# Altium schematic sheet Battery_Charging_Section.SchDoc
size A4; DocumentNumber: 2; SheetNumber: 2; SheetTotal: 9
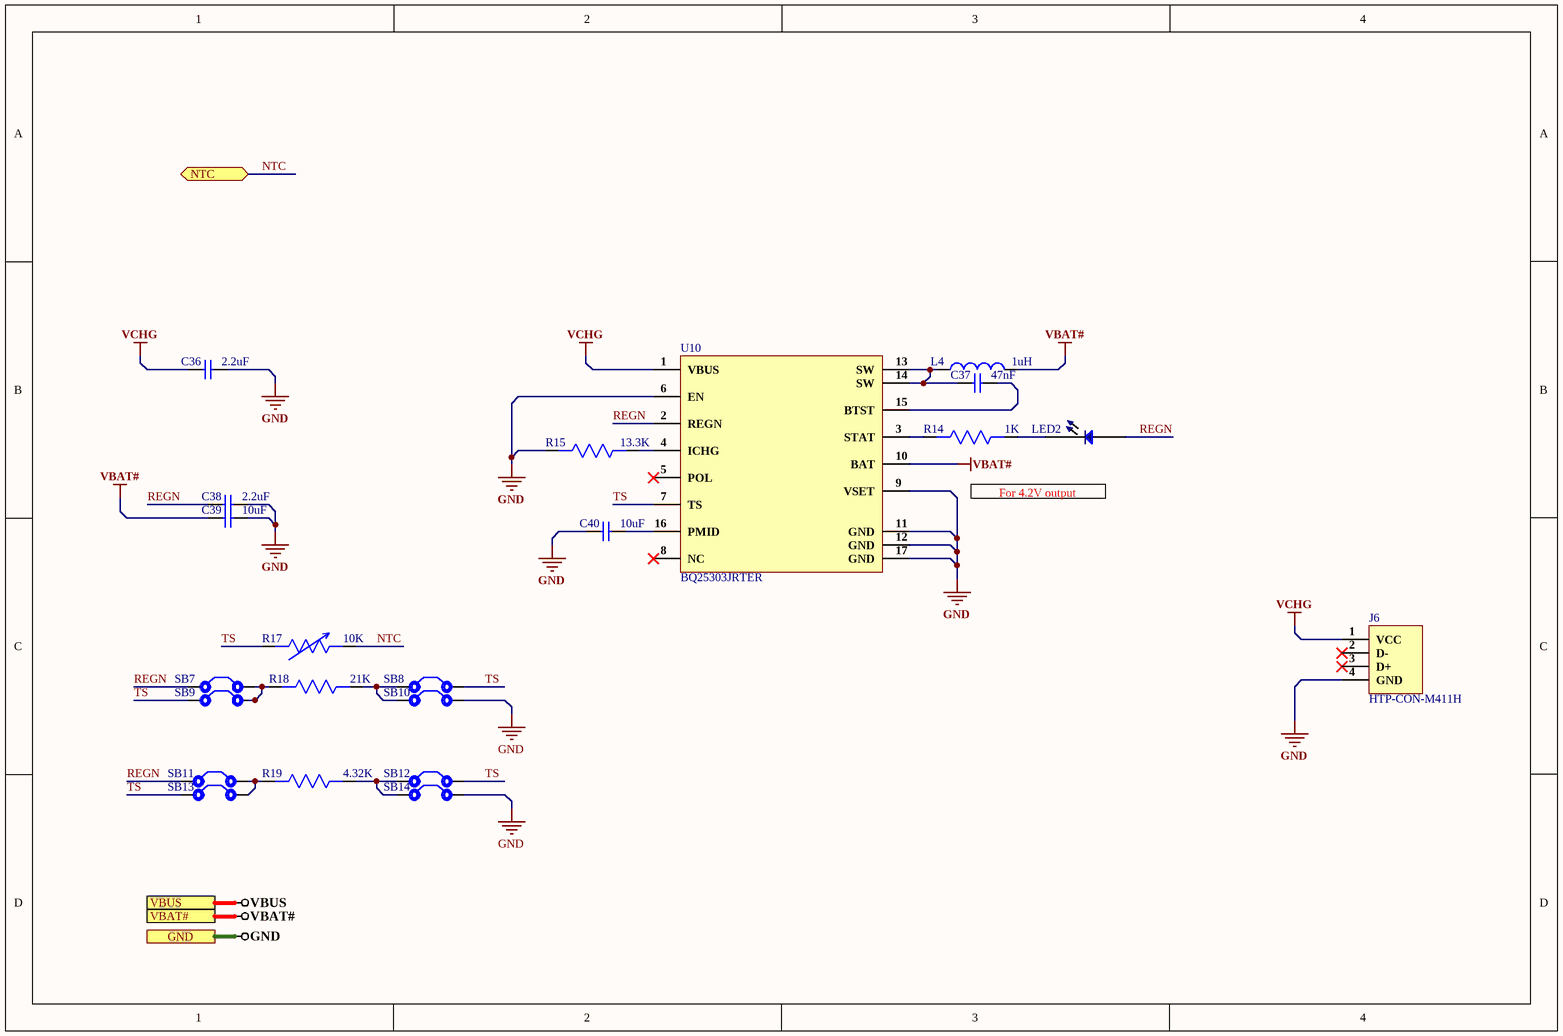
[diagram p0: Battery_Charging_Section.SchDoc]

## Parts
C36  2.2uF  [CAP 0201]
C37  47nF  [CAP 0201]
C38  2.2uF  [CAP 0201]
C39  10uF  [Cap 0402]
C40  10uF  [Cap 0402]
J6  HTP-CON-M411H  [HTP-CON-M411H]
L4  1uH  [IND  0806]
LED2  16-213/GHC-YR1S1/3T  [LED 0402]  (value not drawn)
R14  1K  [Res-0201]
R15  13.3K  [Res-0201]
R17  10K  [Res-0201]
R18  21K  [Res-0201]
R19  4.32K  [Res-0201]
SB7  Solder Bridge  [Solder Bridge]  (value not drawn)
SB8  Solder Bridge  [Solder Bridge]  (value not drawn)
SB9  Solder Bridge  [Solder Bridge]  (value not drawn)
SB10  Solder Bridge  [Solder Bridge]  (value not drawn)
SB11  Solder Bridge  [Solder Bridge]  (value not drawn)
SB12  Solder Bridge  [Solder Bridge]  (value not drawn)
SB13  Solder Bridge  [Solder Bridge]  (value not drawn)
SB14  Solder Bridge  [Solder Bridge]  (value not drawn)
U10  BQ25303JRTER  [16-WQFN (3x3)]

## Ports
GND, NTC (bidir), VBAT#, VBUS

## Nets
GND: C36.2 C38.2 C39.2 C40.1 J6.4(GND) R15.2 SB10.2 SB14.2 U10.6(EN) U10.9(VSET) U10.11(GND) U10.12(GND) U10.17(GND) ; port GND
VBAT#: C39.1 L4.2 U10.10(BAT) ; port VBAT#
VBUS: port VBUS
VCHG: C36.1 J6.1(VCC) U10.1(VBUS)
NTC: R17.1 ; port NTC
REGN: C38.1 LED2.1 SB7.1 SB11.1 U10.2(REGN)
TS: R17.2 SB8.2 SB9.1 SB12.2 SB13.1 U10.7(TS)
NetC37_1: C37.1 L4.1 U10.13(SW) U10.14(SW)
NetC37_2: C37.2 U10.15(BTST)
NetC40_2: C40.2 U10.16(PMID)
NetLED2_2: LED2.2 R14.1
NetR14_2: R14.2 U10.3(STAT)
NetR15_1: R15.1 U10.4(ICHG)
NetR18_1: R18.1 SB8.1 SB10.1
NetR18_2: R18.2 SB7.2 SB9.2
NetR19_1: R19.1 SB12.1 SB14.1
NetR19_2: R19.2 SB11.2 SB13.2

Not connected (* = marked no-connect by the designer): J6 2(D-)* 3(D+)*; U10 5(POL)* 8(NC)*

## Notes on the sheet
- For 4.2V output

## Library data of the parts
C36 C38 = GRM033R61A225ME47D: CAP CER 2.2UF 10V X5R 0201; Manufacturer: Murata; Tolerance: 20%; Supplier 1: Avnet; Manufacturer Part Number: GRM033R61A225ME47D; RoHS: Yes; Category: Ceramic Capacitors; Pricing 1: 15000=0.04772, 30000=0.04483, 60000=0.04193, 90000=0.03904, 120000=0.03615, 150000=0.03495, 1500000=0.03374 (USD); Mount: Surface Mount; Case/Package: 0201; Case Code (Metric): 0603; Case Code (Imperial): 0201; Min Operating Temperature: -55°C; Max Operating Temperature: 85°C; Packaging: Tape and Reel; Capacitance: 2.2uF; Voltage Rating: 10V; Voltage Rating (DC): 10V; Dielectric: X5R; Length: 0.024inch; Width: 0.012inch; Thickness: 0.015inch; RoHS Compliant: Yes; ComponentLink1URL: http://search.murata.co.jp/Ceramy/image/img/A01X/G101/ENG/GRM033R61A225ME47-01.pdf?src-supplier=Digi-Key; ComponentLink1Description: http://search.murata.co.jp/Ceramy/image/img/A01X/G101/ENG/GRM033R61A225ME47-01.pdf?src-supplier=Digi-Key; ComponentLink2URL: https://www.murata.com/~/media/webrenewal/support/library/catalog/products/capacitor/mlcc/c02e.ashx?la=en-us&src-supplier=Digi-Key; ComponentLink2Description: https://www.murata.com/~/media/webrenewal/support/library/catalog/products/capacitor/mlcc/c02e.ashx?la=en-us&src-supplier=Digi-Key; Supplier Part Number 1: GRM033R61A225ME47D
C37 = GRM033R61C473KE84D: CAP SMD .047uF 16V 0201; Manufacturer: Murata; Tolerance: 10%; Dielectric: X5R; Supplier 1: Digi-Key; Manufacturer Part Number: GRM033R61C473KE84D; RoHS: Yes; Category: Ceramic Capacitors; Stock 1: 292349; Pricing 1: 1=0.10000, 10=0.06800, 50=0.03720, 100=0.03040, 500=0.02174, 1000=0.01708, 2500=0.01552, 5000=0.01428 (USD); Mount: Surface Mount; Case/Package: 0201; Case Code (Metric): 0603; Case Code (Imperial): 0201; Weight: 1.2E-05oz; Min Operating Temperature: -55°C; Max Operating Temperature: 85°C; Package Quantity: 15000; Packaging: Tape and Reel; Capacitance: 47nF; Voltage Rating: 16V; Voltage Rating (DC): 16V; Termination: SMD/SMT; Length: 0.024inch; Width: 0.012inch; Height: 0.3mm; Thickness: 0.013inch; Lead Free: Lead Free; RoHS Compliant: Yes; ComponentLink1URL: https://datasheet.ciiva.com/18699/grm033r61c473ke84-01-18699268.pdf?src-supplier=Digi-Key; ComponentLink1Description: https://datasheet.ciiva.com/18699/grm033r61c473ke84-01-18699268.pdf?src-supplier=Digi-Key; ComponentLink2URL: https://datasheet.ciiva.com/18699/partnumbering-e-01-18699269.pdf?src-supplier=Digi-Key; ComponentLink2Description: https://datasheet.ciiva.com/18699/partnumbering-e-01-18699269.pdf?src-supplier=Digi-Key; ComponentLink3URL: https://datasheet.ciiva.com/24221/c02e-24221301.pdf?src-supplier=Mouser; ComponentLink3Description: https://datasheet.ciiva.com/24221/c02e-24221301.pdf?src-supplier=Mouser; ComponentLink4URL: https://datasheet.ciiva.com/18699/partnumbering-e-01-18699270.pdf?src-supplier=Digi-Key; ComponentLink4Description: https://datasheet.ciiva.com/18699/partnumbering-e-01-18699270.pdf?src-supplier=Digi-Key; Supplier Part Number 1: 490-7227-1-ND
C39 C40 = GRM155R61A106ME44D: 10uF ±20% 10V X5R 0402 Multilayer Ceramic Capacitors MLCC - SMD/SMT RoHS; Manufacturer: Murata Electronics; Package: 0402; Capacitance: 10uF; Tolerance: ±20%; Voltage - Rated: Voltage - Rated; Temperature Coefficient: X5R
J6 = HTP-CON-M411H: Straight 4 pin magnetic data connector, stably working, high quality magnetic connectors; Manufacturer: HYTEPRO; Value: Custom; Manufacturer Part No: HTP-CON-M411H; Package: Custom; ComponentLink1Description: Supplier Link; ComponentLink1URL: https://www.hyte.pro/product/m411h.html
L4 = DFE201610E-1R0M=P2: Inductor Power Shielded Wirewound 1uH 20% 1MHz Metal 2.7A 0.057Ohm DCR 0806 T/R; Manufacturer: Murata; Supplier 1: Digi-Key; Manufacturer Part Number: DFE201610E-1R0M=P2; RoHS: Yes; Category: Fixed Inductors; Stock 1: 27; Pricing 1: 1=0.37000, 10=0.32800, 25=0.28680, 50=0.24560, 100=0.22520, 250=0.20476, 500=0.19246, 1000=0.14742 (USD); RoHS Compliant: Yes; ComponentLink1URL: http://www.farnell.com/datasheets/2339713.pdf?src-supplier=Farnell; ComponentLink1Description: http://www.farnell.com/datasheets/2339713.pdf?src-supplier=Farnell; Supplier Part Number 1: 490-18106-1-ND
LED2 = 16-213/GHC-YR1S1/3T: Green 520~535nm 0402 Light Emitting Diodes (LED) RoHS; Manufacturer: Everlight Elec; Luminous Intensity (IF=20mA): 112~285mcd; Package: 0402; Illumination Color: Green; Dominant Wavelength / Coordinate rank: 520~535nm; Mounting Type: Surface Mount
R14 = RC0201FR-071KL: YAGEO - RC0201FR-071KL - RES, 1K, 1%, 0.05W, 0201, THICK FILM; Resistance: 1kR; Temperature Coefficient: 200ppm/°C; Power Rating: 50mW; Voltage Rating: 25V; Supplier 1: Digi-Key; Manufacturer: Yageo; Manufacturer Part Number: RC0201FR-071KL; RoHS: Yes; Category: Chip SMD Resistors; Stock 1: 1020398; Pricing 1: 1=0.10000, 10=0.04200, 100=0.01700, 1000=0.00765, 2500=0.00664, 5000=0.00548 (USD); Case/Package: 0201; Contact Plating: Tin,Matte; Case Code (Metric): 0603; Case Code (Imperial): 0201; Min Operating Temperature: -55°C; Max Operating Temperature: 125°C; Tolerance: 1%; Resistor Type: Thick Film; Package Quantity: 10000; Packaging: Tape and Reel; Number of Terminations: 2; Termination: SMD/SMT; Max Power Dissipation: 50mW; Working Voltage: 25V; Features: Moisture Resistant; Series: RC; Resistance Tolerance: 1%; Technology: THICK FILM; Construction: Rectangular; Length: 0.024inch; Width: 0.012inch; Height: 0.01inch; Depth: 0.3mm; Radiation Hardening: No; REACH SVHC: Unknown; Military Standard: Not; Lead Free: Lead Free; RoHS Compliant: Yes; ComponentLink1URL: https://datasheet.ciiva.com/28419/pyu-rc0201-51-rohs-l-8-28419637.pdf?src-supplier=Avnet+Europe; ComponentLink1Description: https://datasheet.ciiva.com/28419/pyu-rc0201-51-rohs-l-8-28419637.pdf?src-supplier=Avnet+Europe; ComponentLink2URL: https://datasheet.ciiva.com/16855/pyu-rc0201-51-rohs-l-8-16855830.pdf?src-supplier=Avnet+Europe; ComponentLink2Description: https://datasheet.ciiva.com/16855/pyu-rc0201-51-rohs-l-8-16855830.pdf?src-supplier=Avnet+Europe; ComponentLink3URL: https://datasheet.ciiva.com/22698/1563626-22698505.pdf?src-supplier=Element14; ComponentLink3Description: https://datasheet.ciiva.com/22698/1563626-22698505.pdf?src-supplier=Element14; ComponentLink4URL: https://datasheet.ciiva.com/29721/pyu-r-int-thick-7-29721195.pdf?src-supplier=Digi-Key; ComponentLink4Description: https://datasheet.ciiva.com/29721/pyu-r-int-thick-7-29721195.pdf?src-supplier=Digi-Key; ComponentLink5URL: https://datasheet.ciiva.com/7672/1563626-7672204.pdf?src-supplier=Element14; ComponentLink5Description: https://datasheet.ciiva.com/7672/1563626-7672204.pdf?src-supplier=Element14; ComponentLink6URL: https://datasheet.ciiva.com/29721/pyu-r-int-thick-7-29721196.pdf?src-supplier=Digi-Key; ComponentLink6Description: https://datasheet.ciiva.com/29721/pyu-r-int-thick-7-29721196.pdf?src-supplier=Digi-Key; ComponentLink7URL: https://datasheet.ciiva.com/8896/pyu-rc0201-51-rohs-l-8-8896174.pdf?src-supplier=Avnet; ComponentLink7Description: https://datasheet.ciiva.com/8896/pyu-rc0201-51-rohs-l-8-8896174.pdf?src-supplier=Avnet; Supplier Part Number 1: 311-1KMCT-ND
R15 = 0201WMF1332TEE: RES SMD 13.3K  1/20W 0201; Manufacturer: UNI-ROYAL(Uniroyal Elec); Temperature Coefficient: ±200ppm/℃; Package: 0201; Power: 1/20W
R17 = NCP03XH103F05RL: NTC Thermistors 0201; Manufacturer: Murata; Tolerance: 1%; Resistance: 10kR; Power Rating: 100mW; Supplier 1: Arrow Electronics; Manufacturer Part Number: NCP03XH103F05RL; RoHS: Yes; Category: Thermistors; Stock 1: 13718; Pricing 1: 1=0.25690, 10=0.22690, 25=0.17210, 100=0.14240, 250=0.14110, 500=0.11960, 1000=0.10070, 3000=0.09970, 6000=0.08620, 15000=0.18060, 150000=0.17050, 1500000=0.11080, 7500000=0.07850 (USD); Mount: Surface Mount; Case/Package: 0201; Number of Pins: 2; Case Code (Metric): 0603; Case Code (Imperial): 0201; Min Operating Temperature: -40°C; Max Operating Temperature: 125°C; Packaging: Tape and Reel; Package Quantity: 1; Max Power Dissipation: 100mW; Termination: SMD/SMT; Length: 0.6mm; Width: 0.3mm; Height: 0.3mm; Depth: 0.3mm; Radiation Hardening: No; Lead Free: Lead Free; RoHS Compliant: Yes; ComponentLink1URL: http://components.arrow.com/part/dataview/51404656S675687N2606?src-supplier=Arrow+Electronics; ComponentLink1Description: http://components.arrow.com/part/dataview/51404656S675687N2606?src-supplier=Arrow+Electronics; ComponentLink2URL: http://www.mouser.com/ds/2/281/r44e-3685.pdf?src-supplier=Mouser; ComponentLink2Description: http://www.mouser.com/ds/2/281/r44e-3685.pdf?src-supplier=Mouser; ComponentLink3URL: http://components.arrow.com/part/dataview/0323_03440904?src-supplier=Arrow+Europe; ComponentLink3Description: http://components.arrow.com/part/dataview/0323_03440904?src-supplier=Arrow+Europe; ComponentLink4URL: http://www.murata.com/products/catalog/pdf/r44e.pdf?src-supplier=Avnet+Europe; ComponentLink4Description: http://www.murata.com/products/catalog/pdf/r44e.pdf?src-supplier=Avnet+Europe; ComponentLink5URL: http://www.murata.com/products/catalog/pdf/r44e.pdf?src-supplier=Digi-Key; ComponentLink5Description: http://www.murata.com/products/catalog/pdf/r44e.pdf?src-supplier=Digi-Key; ComponentLink6URL: https://www.murata.com/~/media/webrenewal/support/library/catalog/products/thermistor/r01e.ashx?src-supplier=Digi-Key; ComponentLink6Description: https://www.murata.com/~/media/webrenewal/support/library/catalog/products/thermistor/r01e.ashx?src-supplier=Digi-Key; ComponentLink7URL: http://www.murata.com/~/media/webrenewal/support/library/catalog/products/thermistor/ntc/r44e.ashx?src-supplier=Avnet; ComponentLink7Description: http://www.murata.com/~/media/webrenewal/support/library/catalog/products/thermistor/ntc/r44e.ashx?src-supplier=Avnet; Supplier Part Number 1: NCP03XH103F05RL
R18 = AC0201FR-0721KL: Res SMD 21K Ohm 1% 1/20W 0201; Manufacturer: Yageo; Resistance: 21kR; Max Power Dissipation: 50mW; Temperature Coefficient: 200ppm/°C; Supplier 1: Avnet; Manufacturer Part Number: AC0201FR-0721KL; RoHS: Yes; Category: Chip SMD Resistors; Pricing 1: 10000=0.00168, 20000=0.00165, 40000=0.00161, 60000=0.00157, 80000=0.00151, 100000=0.00148, 1000000=0.00144 (USD); Case/Package: 0201; Min Operating Temperature: -55°C; Max Operating Temperature: 155°C; Packaging: Tape and Reel; Resistor Type: Thick Film; Number of Terminations: 2; Tolerance: 1%; Features: Moisture Resistant,Automotive AEC-Q200; Length: 0.024inch; Width: 0.012inch; Height: 0.01inch; RoHS Compliant: Yes; ComponentLink1URL: http://www.yageo.com/NewPortal/yageodocoutput?fileName=/pdf/R-Chip/PYu-AC_51_RoHS_L_6.pdf&src-supplier=Digi-Key; ComponentLink1Description: http://www.yageo.com/NewPortal/yageodocoutput?fileName=/pdf/R-Chip/PYu-AC_51_RoHS_L_6.pdf&src-supplier=Digi-Key; Supplier Part Number 1: AC0201FR-0721KL
R19 = RK73H1HTTC4321F: Thick Film Resistors - SMD 4.32K OHM 1%; Manufacturer: KOA Speer; Power Rating: 50mW; Resistance: 4.32kR; Voltage Rating: 25V; Temperature Coefficient: 200ppm/°C; Supplier 1: Digi-Key; Manufacturer Part Number: RK73H1HTTC4321F; RoHS: Yes; Category: Chip SMD Resistors; Pricing 1: 1000=0.01370 (USD); Case/Package: 0201; Case Code (Imperial): 0201; Case Code (Metric): 0603; Min Operating Temperature: -55°C; Max Operating Temperature: 125°C; Packaging: Tape and Reel; Package Quantity: 10000; Tolerance: 1%; Resistor Type: Thick Film; Termination: SMD/SMT; Voltage Rating (DC): 25V; Series: RK73H; Length: 0.6mm; Width: 0.3mm; Height: 0.23mm; Lead Free: Lead Free; RoHS Compliant: Yes; ComponentLink1URL: https://datasheet.ciiva.com/5556/rk73h-5715-5556569.pdf?src-supplier=Mouser; ComponentLink1Description: https://datasheet.ciiva.com/5556/rk73h-5715-5556569.pdf?src-supplier=Mouser; Supplier Part Number 1: 2019-RK73H1HTTC4321FCT-ND
SB7-SB14 = Solder Bridge: Solder Bridge ON
U10 = BQ25303JRTER: STANDALONE 1-CELL 17-V, 3.0-A BA; Manufacturer: Texas Instruments; Supplier 1: Digi-Key; Manufacturer Part Number: BQ25303JRTER; RoHS: Yes; Stock 1: 2495; Pricing 1: 1=2.19000, 10=1.96600, 25=1.85520, 100=1.58050, 250=1.48400, 500=1.29850, 1000=1.16900 (USD); Supplier Part Number 1: 296-BQ25303JRTERCT-ND